# EasyEDA Pro project 辅助电源.epro, board 次级板
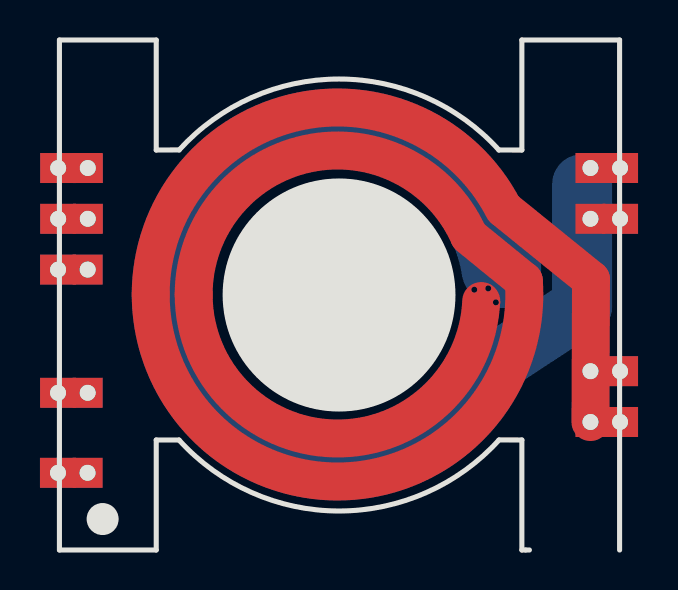
[diagram p9: board, top side]
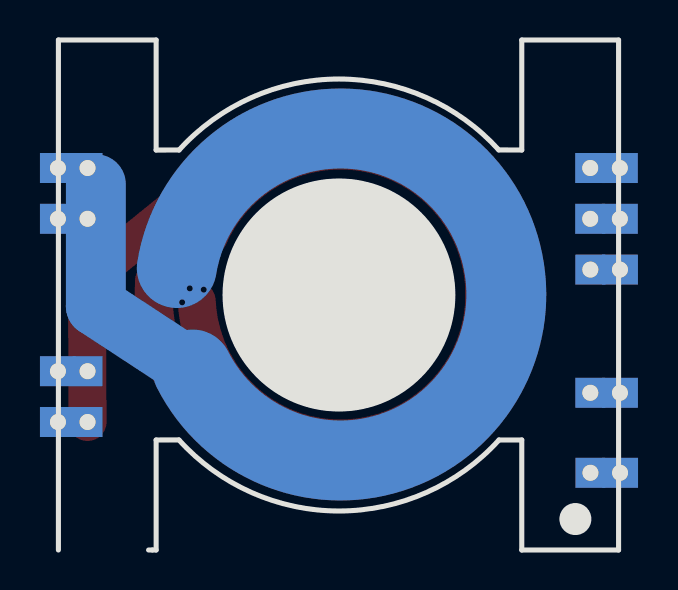
[diagram p10: board, bottom side, seen from below]

Outline 28.04 x 25.5 mm; copper layers: Top Layer, Inner1, Inner2, Bottom Layer. Coordinates in mm from the lower left corner of the outline.
Outline path: 4.85,25.5 0,25.5 0,0 4.85,0 ; 23.15,25.5 28.04,25.5 28.04,0 ; 23.15,0 23.52,0
Stack: Top Layer 0.035mm / Dielectric1 0.48mm PP er 4.5 / Inner1 0.035mm / Dielectric2 0.48mm FR4 er 4.5 / Inner2 0.035mm / Dielectric3 0.48mm PP er 4.5 / Bottom Layer 0.035mm

## Design rules (mm)
spacing Default (default): track to track 0.3, other pairs 0 to 0.3
spacing Plane_Default: track to track 0.3, other pairs 0 to 0.3
spacing Copper_Default: track to track 0.3, other pairs 0 to 0.3
track width Default (default): min 0.2, default 0.2, max 25.4
differential pair differentialPair (default): width min 0.127, default 0.254, max 2.54; gap min 0.152, default 0.152

## Placement (name value [footprint] x y rotation side)
NOREF  -  [Pad_e12]  28.06 16.56 0 top
NOREF#2  -  [Pad_e5]  -0.06 16.56 180 top
NOREF#3  -  [Pad_e7]  -0.07 7.86 180 top
NOREF#4  -  [Pad_e9]  28.06 6.4 0 top
NOREF#5  -  [Pad_e10]  28.06 8.94 0 top
NOREF#6  -  [Pad_e11]  28.06 19.1 0 top
NOREF#7  -  [Pad_e6]  -0.07 14.02 180 top
NOREF#8  -  [Pad_e8]  -0.07 3.86 180 top
NOREF#9  -  [Pad_e4]  -0.06 19.1 180 top
U1  -  [EQ2510_PCB]  14 12.75 0 top

## Footprints (pads in the part's own frame, mm; a bottom-side part is the same pattern mirrored in y, then rotated)
EQ2510_PCB
  rect 1.5x1.5 hole 0.8: 1(-12.576,6.351) 2(-12.576,3.811) 3(-12.581,1.271) 5(-12.581,-4.889) 6(-12.586,-8.889) 6(12.582,-6.349) 7(12.582,-3.809) 8(12.582,3.811) 9(12.582,6.351)
Pad_e4
  rect 1.8x1.5 hole 0.8: 1(0,0)
Pad_e5
  rect 1.8x1.5 hole 0.8: 2(0,0)
Pad_e6
  rect 1.8x1.5 hole 0.8: 3(0,0)
Pad_e7
  rect 1.8x1.5 hole 0.8: 5(0,0)
Pad_e8
  rect 1.8x1.5 hole 0.8: 6(0,0)
Pad_e9
  rect 1.8x1.5 hole 0.8: 6(0,0)
Pad_e10
  rect 1.8x1.5 hole 0.8: 7(0,0)
Pad_e11
  rect 1.8x1.5 hole 0.8: 9(0,0)
Pad_e12
  rect 1.8x1.5 hole 0.8: 8(0,0)

## Nets
PGND: NOREF.8 NOREF#4.6 NOREF#5.7 NOREF#6.9 U1.6 U1.7 U1.8 U1.9

Pads without a net: NOREF#2 2; NOREF#3 5; NOREF#7 3; NOREF#8 6; NOREF#9 1; U1 1 2 3 5

## Via types
v1: diameter 0.45, hole 0.3, Top Layer to Bottom Layer, 3 vias

## Routing (per net, layer and track width the routed paths; a pad name or vN(x,y) marks a point on that pad's centre or on a via; arc(x,y) is an arc through that point)
PGND: length 397.9
  Top Layer w1.9: 20.51,15.68 23.24,13.46 ; 22.29,17.02 26.61,13.53 U1.6 ; 22.22,17.08 arc(11.7,21.86) 4.57,12.78 arc(14.27,3.43) 23.24,13.47 ; 20.48,15.74 arc(12.41,19.81) 6.72,12.78 ; 6.72,12.76 arc(13.76,5.58) 21.11,12.45
  Inner1 w1.9: 22.29,17.02 26.61,13.53 U1.6 ; 20.51,15.68 23.24,13.46 ; 22.22,17.08 arc(11.7,21.86) 4.57,12.78 arc(14.27,3.43) 23.24,13.47 ; 6.72,12.76 arc(13.76,5.58) 21.11,12.45 ; 20.48,15.74 arc(12.41,19.82) 6.72,12.78
  Inner2 w1.9: U1.6 26.61,13.53 22.29,17.02 ; 20.51,15.68 23.24,13.46 ; 6.72,12.76 arc(13.76,5.58) 21.11,12.45 ; 23.24,13.47 arc(14.27,3.43) 4.57,12.78 arc(11.7,21.86) 22.22,17.08 ; 20.48,15.74 arc(12.41,19.81) 6.72,12.78
  Bottom Layer w3: 21.32,9.02 26.16,12.19 26.16,18.29
  Bottom Layer w4: 22.11,14.1 arc(5.72,14.05) 21.32,9.02
  vias: v1(20.76,13.02) v1(21.46,13.08) v1(21.84,12.38)
